# EasyEDA Pro project climbsnail-spotwelder-45c7d2f7.epro, schematic 大号mos板_16管
Create Date: 2023-10-04; Page Name: P1; Project Name: SpotWelder 点焊机; Schematic Name: 大号mos板; Update Date: 2023-10-05; Company: 嘉立创EDA; Page Size: A4; Version: V1.0
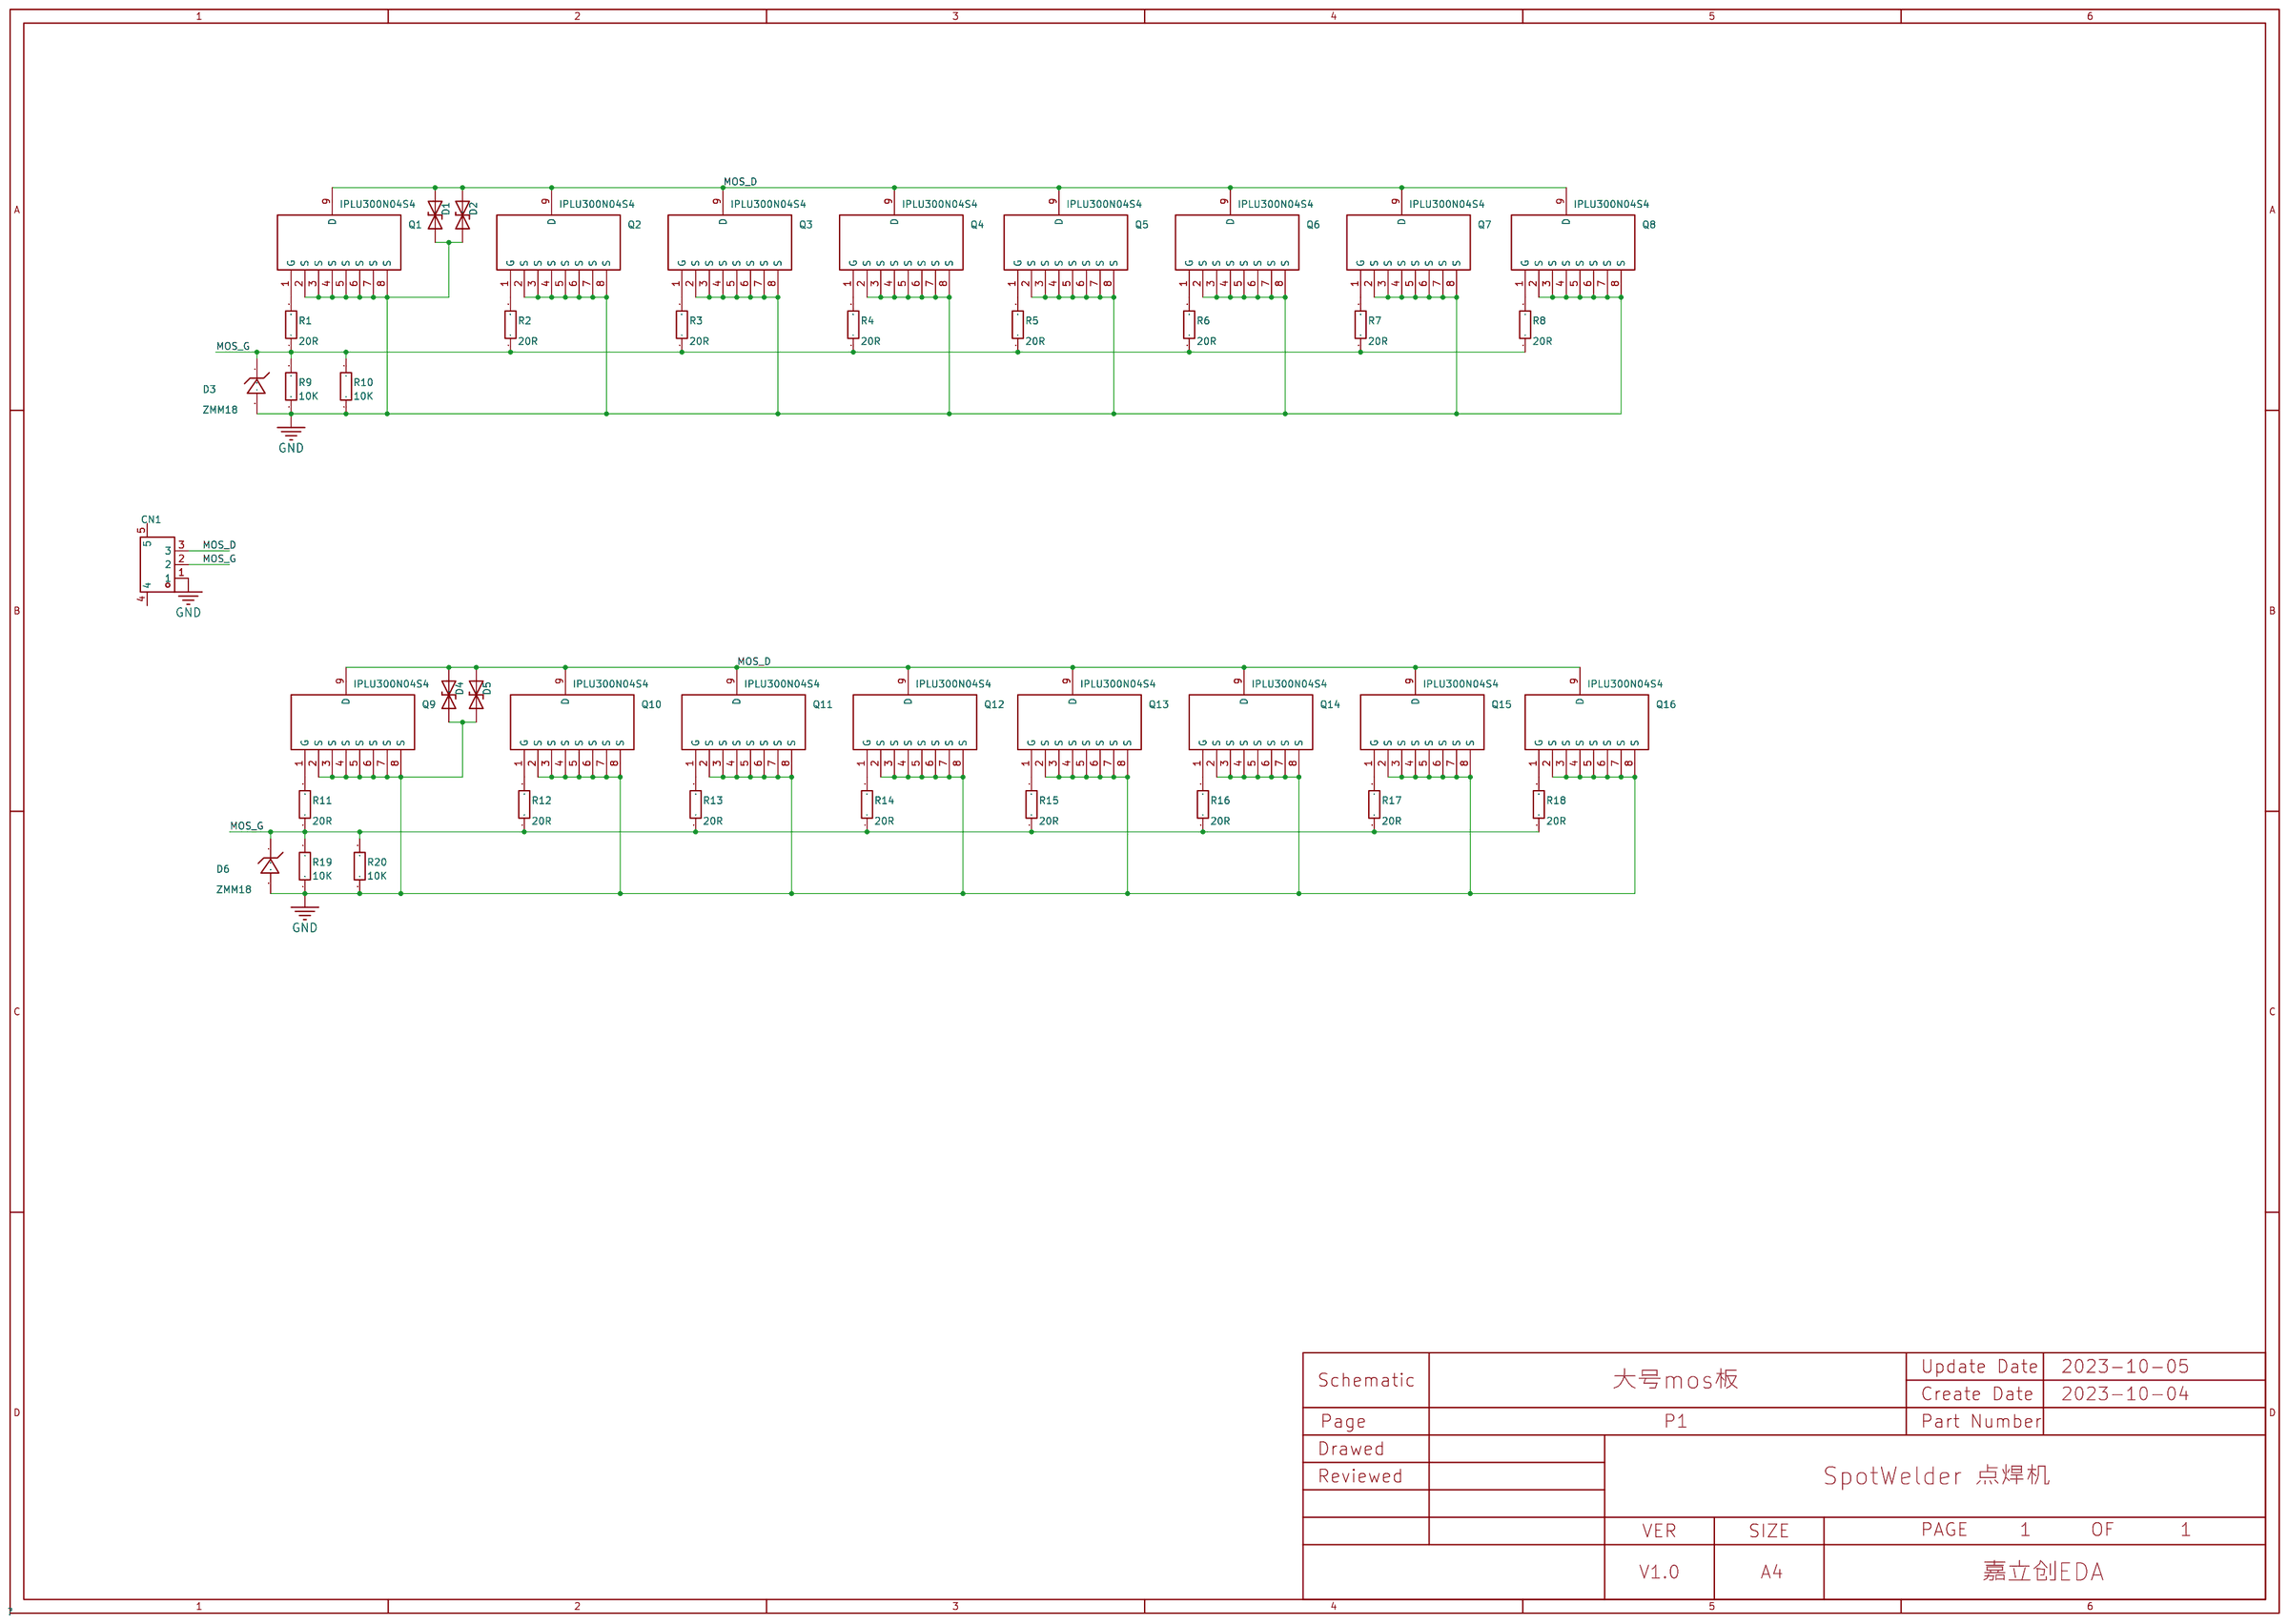
[diagram p1: schematic sheet]

## Parts
CN1  XH2.54-3P  [CONN-SMD_3P-P2.50-WT]
D1  SMBJ28CA双向TVS管  [SMB_L4.6-W3.6-LS5.3-BI]
D2  SMBJ28CA双向TVS管  [SMB_L4.6-W3.6-LS5.3-BI]
D3  ZMM18  [LL-34_L3.5-W1.5-RD]
D4  SMBJ28CA双向TVS管  [SMB_L4.6-W3.6-LS5.3-BI]
D5  SMBJ28CA双向TVS管  [SMB_L4.6-W3.6-LS5.3-BI]
D6  ZMM18  [LL-34_L3.5-W1.5-RD]
Q1  IPLU300N04S4  [HSOF-8_L10.0-W10.5-P1.20_1]
Q2  IPLU300N04S4  [HSOF-8_L10.0-W10.5-P1.20_1]
Q3  IPLU300N04S4  [HSOF-8_L10.0-W10.5-P1.20_1]
Q4  IPLU300N04S4  [HSOF-8_L10.0-W10.5-P1.20_1]
Q5  IPLU300N04S4  [HSOF-8_L10.0-W10.5-P1.20_1]
Q6  IPLU300N04S4  [HSOF-8_L10.0-W10.5-P1.20_1]
Q7  IPLU300N04S4  [HSOF-8_L10.0-W10.5-P1.20_1]
Q8  IPLU300N04S4  [HSOF-8_L10.0-W10.5-P1.20_1]
Q9  IPLU300N04S4  [HSOF-8_L10.0-W10.5-P1.20_1]
Q10  IPLU300N04S4  [HSOF-8_L10.0-W10.5-P1.20_1]
Q11  IPLU300N04S4  [HSOF-8_L10.0-W10.5-P1.20_1]
Q12  IPLU300N04S4  [HSOF-8_L10.0-W10.5-P1.20_1]
Q13  IPLU300N04S4  [HSOF-8_L10.0-W10.5-P1.20_1]
Q14  IPLU300N04S4  [HSOF-8_L10.0-W10.5-P1.20_1]
Q15  IPLU300N04S4  [HSOF-8_L10.0-W10.5-P1.20_1]
Q16  IPLU300N04S4  [HSOF-8_L10.0-W10.5-P1.20_1]
R1  20R  [R0603]
R2  20R  [R0603]
R3  20R  [R0603]
R4  20R  [R0603]
R5  20R  [R0603]
R6  20R  [R0603]
R7  20R  [R0603]
R8  20R  [R0603]
R9  10K  [R0603]
R10  10K  [R0603]
R11  20R  [R0603]
R12  20R  [R0603]
R13  20R  [R0603]
R14  20R  [R0603]
R15  20R  [R0603]
R16  20R  [R0603]
R17  20R  [R0603]
R18  20R  [R0603]
R19  10K  [R0603]
R20  10K  [R0603]

## Library data of the parts
CN1 = XH2.54-3P: Supplier Part: C9900004346; Supplier Footprint: XH2.54-3PSMD; JLCPCB Part Class: 扩展库; Supplier: LCSC
D1 D2 D4 D5 = SMBJ28CA双向TVS管: Pin Type: IN; Supplier: LCSC; Manufacturer Part: SMBJ28CA; Manufacturer: Brightking; Supplier Part: C78417; JLCPCB Part Class: Extended Part
D3 D6 = ZMM18: 二极管配置:独立式;稳压值(标称值):18V;稳压值(范围):16.8V~19.1V;精度:-;功率:500mW;反向电流(Ir):100nA@13V;阻抗(Zzt):50Ω;; LCSC Part Name: 18V 500mW; Supplier Part: C8071; Manufacturer: ST(先科); Supplier Footprint: LL-34; JLCPCB Part Class: Extended Part; Datasheet: https://atta.szlcsc.com/upload/public/pdf/source/20120512/1457706507902.pdf; Supplier: LCSC; Diode Configuration: 独立式; Zener Voltage (Nom): 18V; Zener Voltage (Range): 16.8V~19.1V; Power Dissipation: 500mW; Reverse Leakage Current (Ir): 100nA@13V; Zener Impedance (Zzt): 50Ω
Q1-Q16 = IPLU300N04S4R8XTMA1_1: 类型:N沟道;漏源电压(Vdss):40V;连续漏极电流(Id):300A;功率(Pd):429W;导通电阻(RDS(on)@Vgs,Id):0.77mΩ@10V,100A;阈值电压(Vgs(th)@Id):4V@230A;; LCSC Part Name: N沟道 40V 300A; Supplier Part: C129797; Manufacturer: Infineon(英飞凌); Manufacturer Part: IPLU300N04S4R8XTMA1; Supplier Footprint: H-PSOF-8-1; Datasheet: https://atta.szlcsc.com/upload/public/pdf/source/20170919/C129797_1505787169903976861.pdf; Supplier: LCSC; Type: N沟道; Drain Source Voltage (Vdss): 40V; Continuous Drain Current (Id): 300A; Power Dissipation (Pd): 429W; Drain Source On Resistance (RDS(on)@Vgs,Id): 0.77mΩ@10V,100A; Gate Threshold Voltage (Vgs(th)@Id): 4V@230A; JLCPCB Part Class: Extended Part
R1-R20 = Res_0603: Supplier Footprint: 0603

## Nets
GND: CN1.1 D1.2(A) D2.2(A) D3.2(A) D4.2(A) D5.2(A) D6.2(A) Q1.2(S) Q1.3(S) Q1.4(S) Q1.5(S) Q1.6(S) Q1.7(S) Q1.8(S) Q2.2(S) Q2.3(S) Q2.4(S) Q2.5(S) Q2.6(S) Q2.7(S) Q2.8(S) Q3.2(S) Q3.3(S) Q3.4(S) Q3.5(S) Q3.6(S) Q3.7(S) Q3.8(S) Q4.2(S) Q4.3(S) Q4.4(S) Q4.5(S) Q4.6(S) Q4.7(S) Q4.8(S) Q5.2(S) Q5.3(S) Q5.4(S) Q5.5(S) Q5.6(S) Q5.7(S) Q5.8(S) Q6.2(S) Q6.3(S) Q6.4(S) Q6.5(S) Q6.6(S) Q6.7(S) Q6.8(S) Q7.2(S) Q7.3(S) Q7.4(S) Q7.5(S) Q7.6(S) Q7.7(S) Q7.8(S) Q8.2(S) Q8.3(S) Q8.4(S) Q8.5(S) Q8.6(S) Q8.7(S) Q8.8(S) Q9.2(S) Q9.3(S) Q9.4(S) Q9.5(S) Q9.6(S) Q9.7(S) Q9.8(S) Q10.2(S) Q10.3(S) Q10.4(S) Q10.5(S) Q10.6(S) Q10.7(S) Q10.8(S) Q11.2(S) Q11.3(S) Q11.4(S) Q11.5(S) Q11.6(S) Q11.7(S) Q11.8(S) Q12.2(S) Q12.3(S) Q12.4(S) Q12.5(S) Q12.6(S) Q12.7(S) Q12.8(S) Q13.2(S) Q13.3(S) Q13.4(S) Q13.5(S) Q13.6(S) Q13.7(S) Q13.8(S) Q14.2(S) Q14.3(S) Q14.4(S) Q14.5(S) Q14.6(S) Q14.7(S) Q14.8(S) Q15.2(S) Q15.3(S) Q15.4(S) Q15.5(S) Q15.6(S) Q15.7(S) Q15.8(S) Q16.2(S) Q16.3(S) Q16.4(S) Q16.5(S) Q16.6(S) Q16.7(S) Q16.8(S) R9.1 R10.1 R19.1 R20.1
MOS_D: CN1.3 D1.1(K) D2.1(K) D4.1(K) D5.1(K) Q1.9(D) Q2.9(D) Q3.9(D) Q4.9(D) Q5.9(D) Q6.9(D) Q7.9(D) Q8.9(D) Q9.9(D) Q10.9(D) Q11.9(D) Q12.9(D) Q13.9(D) Q14.9(D) Q15.9(D) Q16.9(D)
MOS_G: CN1.2 D3.1(C) D6.1(C) R1.1 R2.1 R3.1 R4.1 R5.1 R6.1 R7.1 R8.1 R9.2 R10.2 R11.1 R12.1 R13.1 R14.1 R15.1 R16.1 R17.1 R18.1 R19.2 R20.2
$1N10367: Q1.1(G) R1.2
$1N10753: Q2.1(G) R2.2
$1N10869: Q3.1(G) R3.2
$1N10985: Q4.1(G) R4.2
$1N11101: Q5.1(G) R5.2
$1N11217: Q6.1(G) R6.2
$1N64306: Q7.1(G) R7.2
$1N64637: Q8.1(G) R8.2
$1N106030: Q10.1(G) R12.2
$1N106031: Q11.1(G) R13.2
$1N106032: Q12.1(G) R14.2
$1N106033: Q9.1(G) R11.2
$1N106034: Q13.1(G) R15.2
$1N106035: Q14.1(G) R16.2
$1N106036: Q15.1(G) R17.2
$1N106037: Q16.1(G) R18.2

Not connected (* = marked no-connect by the designer): CN1 4 5
